# Altium schematic sheet DISPLAY - HDMI 2.0.schdoc
size 420 x 298 mm; Symbol: Sheet-Symbol_A3; Company: 嘉立创EDA; Version: V1.0; Page Size: A3; @Project Name: 【全网首发】X86电脑主板_copy; @Page Count: 14; @Update Date: 2025-10-09; @Create Date: 2025-10-09; @Schematic Name: SCHEMATIC1_1; @Page No: 0; @Page Name: DISPLAY - HDMI 2.0; Device: Sheet-Symbol_A3
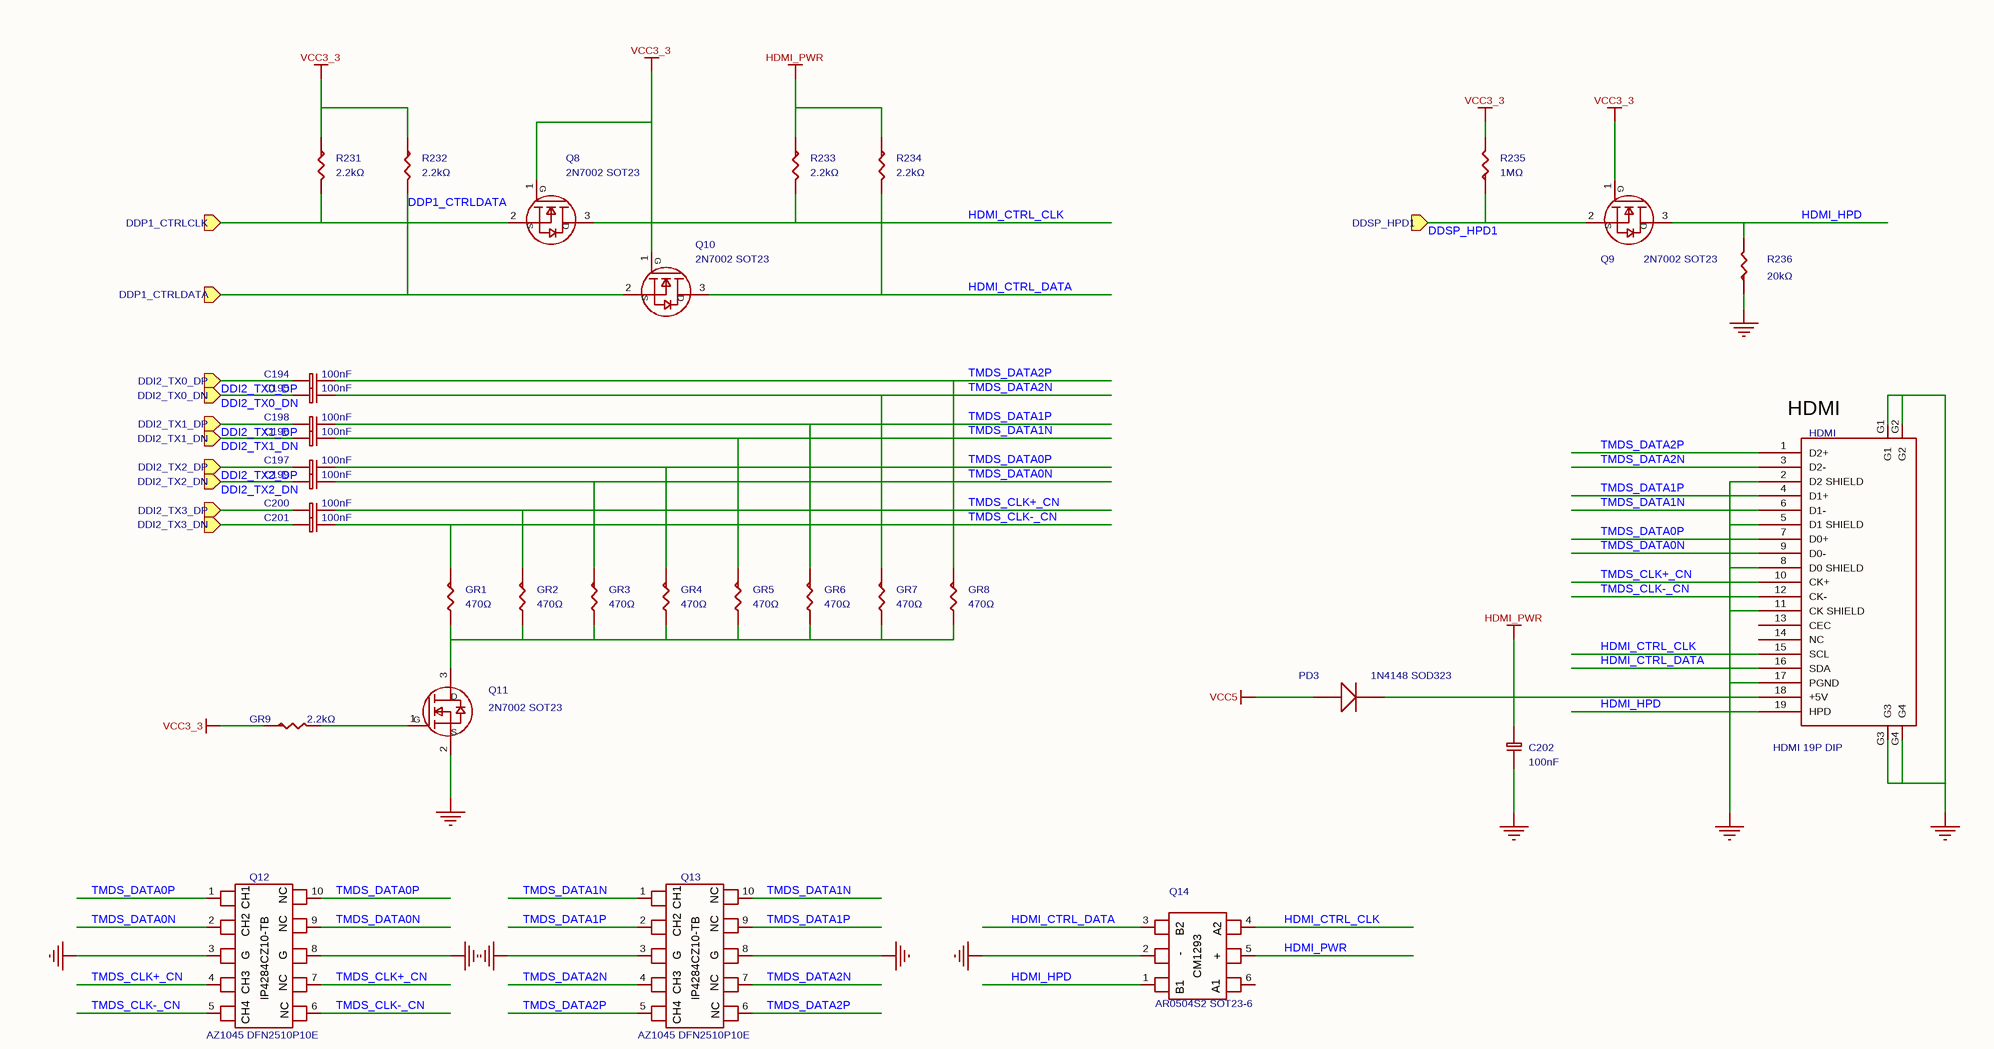
[diagram p0: DISPLAY - HDMI 2.0.schdoc]

## Parts
C194  100nF  [C0402]
C195  100nF  [C0402]
C196  100nF  [C0402]
C197  100nF  [C0402]
C198  100nF  [C0402]
C199  100nF  [C0402]
C200  100nF  [C0402]
C201  100nF  [C0402]
C202  100nF  [C0402]
GR1  470Ω  [R0402_2]
GR2  470Ω  [R0402_2]
GR3  470Ω  [R0402_2]
GR4  470Ω  [R0402_2]
GR5  470Ω  [R0402_2]
GR6  470Ω  [R0402_2]
GR7  470Ω  [R0402_2]
GR8  470Ω  [R0402_2]
GR9  2.2kΩ  [R0402_3]
HDMI  value HDMI 19P DIP  [HDMI3F19_2H61_AKL]  (hidden comment: CONN HDMI_0)
PD3  value 1N4148 SOD323  [1N4148WS-7-SOD323]  (hidden comment: 1N4148WS)
Q8  value 2N7002 SOT23  [SOT23_126]  (hidden comment: 2N7002)
Q9  value 2N7002 SOT23  [SOT23_126]  (hidden comment: 2N7002)
Q10  value 2N7002 SOT23  [SOT23_126]  (hidden comment: 2N7002)
Q11  value 2N7002 SOT23  [SOT23_126]  (hidden comment: 2N7002)
Q12  value AZ1045 DFN2510P10E  [DFN2510P10E]  (hidden comment: AZ1045-04F)
Q13  value AZ1045 DFN2510P10E  [DFN2510P10E_1]  (hidden comment: AZ1045-04F)
Q14  value AR0504S2 SOT23-6  [SOT23-6P-20051228_1]  (hidden comment: SRV05-4)
R231  2.2kΩ  [R0402_3]
R232  2.2kΩ  [R0402_3]
R233  2.2kΩ  [R0402_1]
R234  2.2kΩ  [R0402_3]
R235  1MΩ  [R0402_1]
R236  20kΩ  [R0402_3]

## Ports
DDI2_TX0_DN (in), DDI2_TX0_DP (in), DDI2_TX1_DN (in), DDI2_TX1_DP (in), DDI2_TX2_DN (in), DDI2_TX2_DP (in), DDI2_TX3_DN (in), DDI2_TX3_DP (in), DDP1_CTRLCLK (in), DDP1_CTRLDATA (in), DDSP_HPD1 (in)

## Nets
GND: C202.2 HDMI.2(D2_SHIELD) HDMI.5(D1_SHIELD) HDMI.8(D0_SHIELD) HDMI.11(CK_SHIELD) HDMI.17(PGND) HDMI.G1 HDMI.G2 HDMI.G3 HDMI.G4 Q11.2(S) Q12.3 Q12.8 Q13.3 Q13.8 Q14.2 R236.1
HDMI_PWR: C202.1 HDMI.18(+5V) PD3.1(C) Q14.5(+) R233.1 R234.1
VCC3_3: GR9.1 Q8.1(G) Q9.1(G) Q10.1(G) R231.1 R232.1 R235.2
VCC5: PD3.2(A)
DDI2_TX0_DN: C195.2 ; port DDI2_TX0_DN
DDI2_TX0_DP: C194.2 ; port DDI2_TX0_DP
DDI2_TX1_DN: C196.2 ; port DDI2_TX1_DN
DDI2_TX1_DP: C198.2 ; port DDI2_TX1_DP
DDI2_TX2_DN: C199.2 ; port DDI2_TX2_DN
DDI2_TX2_DP: C197.2 ; port DDI2_TX2_DP
DDI2_TX3_DN: C201.2 ; port DDI2_TX3_DN
DDI2_TX3_DP: C200.2 ; port DDI2_TX3_DP
DDP1_CTRLCLK: Q8.2(S) R231.2 ; port DDP1_CTRLCLK
DDP1_CTRLDATA: Q10.2(S) R232.2 ; port DDP1_CTRLDATA
DDSP_HPD1: Q9.2(S) R235.1 ; port DDSP_HPD1
HDMI_CTRL_CLK: HDMI.15(SCL) Q8.3(D) Q14.4 R233.2
HDMI_CTRL_DATA: HDMI.16(SDA) Q10.3(D) Q14.3 R234.2
HDMI_HPD: HDMI.19(HPD) Q9.3(D) Q14.1 R236.2
TMDS_CLK+_CN: C200.1 GR2.1 HDMI.10(CK+) Q12.4 Q12.7
TMDS_CLK-_CN: C201.1 GR1.1 HDMI.12(CK-) Q12.5(+) Q12.6
TMDS_DATA0N: C199.1 GR3.1 HDMI.9(D0-) Q12.2 Q12.9
TMDS_DATA0P: C197.1 GR4.1 HDMI.7(D0+) Q12.1 Q12.10
TMDS_DATA1N: C196.1 GR5.1 HDMI.6(D1-) Q13.1 Q13.10
TMDS_DATA1P: C198.1 GR6.1 HDMI.4(D1+) Q13.2 Q13.9
TMDS_DATA2N: C195.1 GR7.1 HDMI.3(D2-) Q13.4 Q13.7
TMDS_DATA2P: C194.1 GR8.1 HDMI.1(D2+) Q13.5(+) Q13.6
NetGR1_2: GR1.2 GR2.2 GR3.2 GR4.2 GR5.2 GR6.2 GR7.2 GR8.2 Q11.3(D)
NetGR9_2: GR9.2 Q11.1(G)

Not connected (* = marked no-connect by the designer): HDMI 13(CEC) 14(NC); Q14 6

## Notes on the sheet
- (near HDMI) HDMI
- 更新日期
- 2025-10-09
- 原理图
- 图页
- SCHEMATIC1_1
- DISPLAY - HDMI 2.0
- 创建日期
- 物料编码
- 审阅
- 绘制
- 【全网首发】X86电脑主板_copy
- 版本
- V1.0
- 尺寸
- A3
- 页
- 0
- 嘉立创EDA
- 共
- 14
- (in symbol AZ1045-04F) CH1; NC; CH2; G; CH3; IP4284CZ10-TB; CH4
- (in symbol SRV05-4_C558418) B2; A2; CM1293; -; B1; A1

## Library data of the parts
C194-C201 = CL05B104KO5NNNC: 容值:100nF;精度:±10%;额定电压:16V;材质(温度系数):X7R;; Manufacturer: SAMSUNG(三星); Symbol: CAP NP_23; ModelId: 36a51122f27c49738f86b3bfa98863e0; Tolerance: ±10%; AddInBom: yes; Voltage Rated: 16V; ModelName: C0402_L1.0-W0.5-H0.5; ModelTransform: 39.37,19.685,0,0,0,0,0,0,0; Temperature Coefficient: X7R; Device: CL05B104KO5NNNC; Value: 100nF; Supplier: LCSC; Datasheet: https://atta.szlcsc.com/upload/public/pdf/source/20160103/1457707674891.pdf; FootprintName: C0402; SupplierPart: C1525; ConvertToPcb: yes; LCSC Part Name: 100nF ±10% 16V; JLCPCB Part Class: Basic Part; ManufacturerPart: CL05B104KO5NNNC; Supplier Footprint: 0402
C202 = CL05B104KO5NNNC: 容值:100nF;精度:±10%;额定电压:16V;材质(温度系数):X7R;; Manufacturer: SAMSUNG(三星); Symbol: CAP; Tolerance: ±10%; ModelId: 36a51122f27c49738f86b3bfa98863e0; AddInBom: yes; Voltage Rated: 16V; ModelName: C0402_L1.0-W0.5-H0.5; ModelTransform: 39.37,19.685,0,0,0,0,0,0,0; Temperature Coefficient: X7R; Device: CL05B104KO5NNNC; PCB Footprint: C0402; Value: 100nF; Supplier: LCSC; Datasheet: https://atta.szlcsc.com/upload/public/pdf/source/20160103/1457707674891.pdf; FootprintName: C0402; SupplierPart: C1525; ConvertToPcb: yes; LCSC Part Name: 100nF ±10% 16V; JLCPCB Part Class: Basic Part; ManufacturerPart: CL05B104KO5NNNC; Supplier Footprint: 0402
GR1-GR8 = 0402WGF4700TCE: 电阻类型:厚膜电阻;阻值:470Ω;精度:±1%;功率:62.5mW;; Manufacturer: UNI-ROYAL(厚声); Symbol: R-0603; ModelId: 671aefced39d4c318694bba8bd8efd39; Tolerance: ±1%; AddInBom: yes; Power(Watts): 62.5mW; ModelName: R0402_L1.0-W0.5-H0.5; ModelTransform: 39.37,19.685,0,0,0,0,0,0.0005,0; Overload Voltage (Max): 50V; Temperature Coefficient: ±100ppm/℃; Device: 0402WGF4700TCE; Value: 470Ω; Type: 厚膜电阻; Supplier: LCSC; Datasheet: https://atta.szlcsc.com/upload/public/pdf/source/20200306/C422600_1E6D84923E4A46A82E41ADD87F860B5C.pdf; FootprintName: R0402_2; SupplierPart: C25117; ConvertToPcb: yes; LCSC Part Name: 470Ω ±1% 62.5mW; JLCPCB Part Class: Basic Part; ManufacturerPart: 0402WGF4700TCE; Supplier Footprint: 0402; Operating Temperature Range: -55℃~+155℃
GR9 = 0402WGF2201TCE: 电阻类型:厚膜电阻;阻值:2.2kΩ;精度:±1%;功率:62.5mW;; Manufacturer: UNI-ROYAL(厚声); Symbol: R-0603; ModelId: 671aefced39d4c318694bba8bd8efd39; Tolerance: ±1%; AddInBom: yes; Power(Watts): 62.5mW; ModelName: R0402_L1.0-W0.5-H0.5; ModelTransform: 39.37,19.685,0,0,0,0,0,0.0005,0; Overload Voltage (Max): 50V; Temperature Coefficient: ±100ppm/℃; Device: 0402WGF2201TCE; Value: 2.2kΩ; Type: 厚膜电阻; Supplier: LCSC; Datasheet: https://atta.szlcsc.com/upload/public/pdf/source/20200306/C422600_1E6D84923E4A46A82E41ADD87F860B5C.pdf; FootprintName: R0402_3; SupplierPart: C25879; ConvertToPcb: yes; LCSC Part Name: 2.2kΩ ±1% 62.5mW; JLCPCB Part Class: Basic Part; ManufacturerPart: 0402WGF2201TCE; Supplier Footprint: 0402; Operating Temperature Range: -55℃~+155℃
HDMI = CONN HDMI_0: AddInBom: yes; Device: CONN HDMI_0; Symbol: CONN HDMI_0; Supplier Part: C2926858; FootprintName: HDMI3F19_2H61_AKL; ConvertToPcb: yes
PD3 = 1N4148WS_C917117: 二极管配置:独立式;正向压降(Vf):1.25V@150mA;直流反向耐压(Vr):100V;平均整流电流(Io):300mA;功率:400mW;反向恢复时间(trr):8ns;; Manufacturer: JSMSEMI(杰盛微); Symbol: DIODE_1; AddInBom: yes; ModelId: e9dd044ee7bf4221b3b795eb56bce7c0; ModelName: SOD-323_L1.7-W1.3-H1.1-LS2.5; ModelTransform: 98.91933,51.181,0,180,0,0,0.985,-0.0005,0; Diode Configuration: 独立式; Reverse Voltage (Vr): 100V; Average Rectified Current (Io): 300mA; Power Dissipation: 400mW; Reverse Leakage Current: 1uA@75V; Reverse Recovery Time (trr): 8ns; Device: 1N4148WS_C917117; LCSC Part Name: 电压:100V 电流:300mA; SupplierPart: C917117; ManufacturerPart: 1N4148WS; Supplier Footprint: SOD-323; JLCPCB Part Class: Extended Part; Datasheet: https://atta.szlcsc.com/upload/public/pdf/source/20230807/08D9F448A82EA88A23B325A669586A09.pdf; Supplier: LCSC; ConvertToPcb: yes; FootprintName: 1N4148WS-7-SOD323; Forward Voltage (Vf@If): 1.25V@150mA; Operating Temperature: -55℃~+150℃@(Tj)
Q8-Q11 = 2N7002_C8545: 类型:N沟道;漏源电压(Vdss):60V;连续漏极电流(Id):115mA;功率(Pd):200mW;导通电阻(RDS(on)@Vgs,Id):7.5Ω@10V,500mA;阈值电压(Vgs(th)@Id):2.5V@250uA;; Manufacturer: CJ(江苏长电/长晶); Symbol: NMOSFET SOT-23_0; Type: N沟道; ModelId: c62791f0466c4ae2a892c056b845b0ca; AddInBom: yes; ModelName: SOT-23-3P_L2.9-W1.3-H1.0-LS2.4-P0.95; ModelTransform: 98.425,114.173,0,180,0,0,0.0005,-0.0005,0; Power Dissipation (Pd): 200mW; Drain Source Voltage (Vdss): 60V; Continuous Drain Current (Id): 115mA; Device: 2N7002_C8545; Supplier: LCSC; Datasheet: https://atta.szlcsc.com/upload/public/pdf/source/20170302/1488422688078.pdf; FootprintName: SOT23_126; SupplierPart: C8545; ConvertToPcb: yes; LCSC Part Name: N沟道 60V 115mA; JLCPCB Part Class: Basic Part; ManufacturerPart: 2N7002; Supplier Footprint: SOT-23; Gate Threshold Voltage (Vgs(th)@Id): 2.5V@250uA; Drain Source On Resistance (RDS(on)@Vgs,Id): 7.5Ω@10V,500mA
Q12 Q13 = AZ1045-04F: Manufacturer: TECH PUBLIC(台舟); Symbol: CM1293_1; AddInBom: yes; ModelId: 55525fa8fc914f7c8ffcb10749ea5f73; ModelName: DFN-10_L2.5-W1.0-H0.5-P0.50; ModelTransform: 40.1574,98.425,0,90,0,0,0,0,0; Type: ESD; Device: AZ1045-04F; LCSC Part Name: AZ1045-04F; SupplierPart: C2987152; ManufacturerPart: AZ1045-04F; Supplier Footprint: DFN2510-10; JLCPCB Part Class: Extended Part; Datasheet: https://atta.szlcsc.com/upload/public/pdf/source/20220406/8EAFF16680D4CFE618D2B8CBCD10F1DA.pdf; Supplier: LCSC; ConvertToPcb: yes
  Q12: FootprintName: DFN2510P10E
  Q13: FootprintName: DFN2510P10E_1
Q14 = SRV05-4_C558418: 反向截止电压(Vrwm):5V;最大钳位电压:20V;峰值脉冲电流(Ipp)@10/1000us:3A;击穿电压:6V;; Manufacturer: TECH PUBLIC(台舟); Symbol: CM1293_0; AddInBom: yes; ModelId: 18da8f6c14a34920b3e136b5c401a119; ModelName: SOT-23-6_L2.9-W1.6-H1.5-LS2.8-P0.95; ModelTransform: 110.236,113.364,0,90,0,0,0.0005,0.0005,0; Reverse Stand-Off Voltage (Vrwm): 5V; Maximum Clamping Voltage: 20V; Peak Pulse Current (Ipp)@10/1000us: 3A; Breakdown Voltage: 6V; Type: ESD; Device: SRV05-4_C558418; LCSC Part Name: ESD，可防25kV静电; SupplierPart: C558418; ManufacturerPart: SRV05-4; Supplier Footprint: SOT-23-6; JLCPCB Part Class: Extended Part; Datasheet: https://atta.szlcsc.com/upload/public/pdf/source/20230615/CFFDFFE99FDA0E92DF9600783B3A2A20.pdf; Supplier: LCSC; ConvertToPcb: yes; FootprintName: SOT23-6P-20051228_1
R231-R234 = 0402WGF2201TCE: 电阻类型:厚膜电阻;阻值:2.2kΩ;精度:±1%;功率:62.5mW;; Manufacturer: UNI-ROYAL(厚声); Symbol: RESISTOR; ModelId: 671aefced39d4c318694bba8bd8efd39; Tolerance: ±1%; AddInBom: yes; Power(Watts): 62.5mW; ModelName: R0402_L1.0-W0.5-H0.5; ModelTransform: 39.37,19.685,0,0,0,0,0,0.0005,0; Overload Voltage (Max): 50V; Temperature Coefficient: ±100ppm/℃; Device: 0402WGF2201TCE; Value: 2.2kΩ; Type: 厚膜电阻; Supplier: LCSC; Datasheet: https://atta.szlcsc.com/upload/public/pdf/source/20200306/C422600_1E6D84923E4A46A82E41ADD87F860B5C.pdf; SupplierPart: C25879; ConvertToPcb: yes; LCSC Part Name: 2.2kΩ ±1% 62.5mW; JLCPCB Part Class: Basic Part; ManufacturerPart: 0402WGF2201TCE; Supplier Footprint: 0402; Operating Temperature Range: -55℃~+155℃
  R231 R232 R234: FootprintName: R0402_3
  R233: FootprintName: R0402_1
R235 = 0402WGF1004TCE: 电阻类型:厚膜电阻;阻值:1MΩ;精度:±1%;功率:62.5mW;; Manufacturer: UNI-ROYAL(厚声); Symbol: RESISTOR; ModelId: 671aefced39d4c318694bba8bd8efd39; Tolerance: ±1%; AddInBom: yes; Power(Watts): 62.5mW; ModelName: R0402_L1.0-W0.5-H0.5; ModelTransform: 39.37,19.685,0,0,0,0,0,0.0005,0; Overload Voltage (Max): 50V; Temperature Coefficient: ±100ppm/℃; Device: 0402WGF1004TCE; Value: 1MΩ; Type: 厚膜电阻; Supplier: LCSC; Datasheet: https://atta.szlcsc.com/upload/public/pdf/source/20200306/C422600_1E6D84923E4A46A82E41ADD87F860B5C.pdf; FootprintName: R0402_1; SupplierPart: C26083; ConvertToPcb: yes; LCSC Part Name: 1MΩ ±1% 62.5mW; JLCPCB Part Class: Basic Part; ManufacturerPart: 0402WGF1004TCE; Supplier Footprint: 0402; Operating Temperature Range: -55℃~+155℃
R236 = 0402WGF2002TCE: 电阻类型:厚膜电阻;阻值:20kΩ;精度:±1%;功率:62.5mW;; Manufacturer: UNI-ROYAL(厚声); Symbol: RESISTOR; ModelId: 671aefced39d4c318694bba8bd8efd39; Tolerance: ±1%; AddInBom: yes; Power(Watts): 62.5mW; ModelName: R0402_L1.0-W0.5-H0.5; ModelTransform: 39.37,19.685,0,0,0,0,0,0.0005,0; Overload Voltage (Max): 50V; Temperature Coefficient: ±100ppm/℃; Device: 0402WGF2002TCE; Value: 20kΩ; Type: 厚膜电阻; Supplier: LCSC; Datasheet: https://atta.szlcsc.com/upload/public/pdf/source/20200306/C422600_1E6D84923E4A46A82E41ADD87F860B5C.pdf; FootprintName: R0402_3; SupplierPart: C25765; ConvertToPcb: yes; LCSC Part Name: 20kΩ ±1% 62.5mW; JLCPCB Part Class: Basic Part; ManufacturerPart: 0402WGF2002TCE; Supplier Footprint: 0402; Operating Temperature Range: -55℃~+155℃